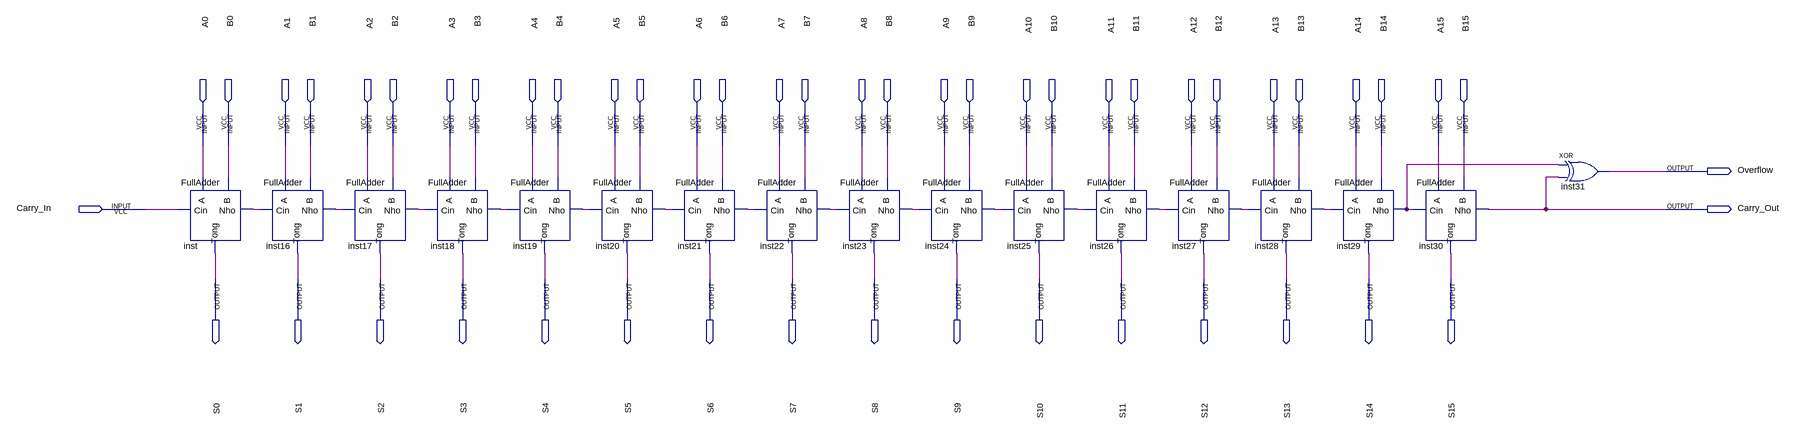
[diagram p0: schematic sheet]
// Quartus schematic FA_16bit.bdf as structural Verilog: 17 symbols, 51 pins
module FA_16bit (
  input  A0,
  input  B0,
  input  A1,
  input  B1,
  input  A2,
  input  B2,
  input  A3,
  input  B3,
  input  A4,
  input  B4,
  input  A5,
  input  B5,
  input  A6,
  input  B6,
  input  A7,
  input  B7,
  input  A8,
  input  B8,
  input  A9,
  input  B9,
  input  A10,
  input  B10,
  input  A11,
  input  B11,
  input  A12,
  input  B12,
  input  A13,
  input  B13,
  input  A14,
  input  B14,
  input  A15,
  input  B15,
  input  Carry_In,
  output Overflow,
  output Carry_Out,
  output S0,
  output S1,
  output S2,
  output S3,
  output S4,
  output S5,
  output S6,
  output S7,
  output S8,
  output S9,
  output S10,
  output S11,
  output S12,
  output S13,
  output S14,
  output S15
);

  wire inst16_nho, inst17_nho, inst18_nho, inst19_nho, inst20_nho, inst21_nho, inst22_nho, inst23_nho,
       inst24_nho, inst25_nho, inst26_nho, inst27_nho, inst28_nho, inst29_nho, inst_nho;

  FullAdder inst (.Cin(Carry_In), .A(A0), .B(B0), .Tong(S0), .Nho(inst_nho));
  FullAdder inst16 (.Cin(inst_nho), .A(A1), .B(B1), .Tong(S1), .Nho(inst16_nho));
  FullAdder inst17 (.Cin(inst16_nho), .A(A2), .B(B2), .Tong(S2), .Nho(inst17_nho));
  FullAdder inst18 (.Cin(inst17_nho), .A(A3), .B(B3), .Tong(S3), .Nho(inst18_nho));
  FullAdder inst19 (.Cin(inst18_nho), .A(A4), .B(B4), .Tong(S4), .Nho(inst19_nho));
  FullAdder inst20 (.Cin(inst19_nho), .A(A5), .B(B5), .Tong(S5), .Nho(inst20_nho));
  FullAdder inst21 (.Cin(inst20_nho), .A(A6), .B(B6), .Tong(S6), .Nho(inst21_nho));
  FullAdder inst22 (.Cin(inst21_nho), .A(A7), .B(B7), .Tong(S7), .Nho(inst22_nho));
  FullAdder inst23 (.Cin(inst22_nho), .A(A8), .B(B8), .Tong(S8), .Nho(inst23_nho));
  FullAdder inst24 (.Cin(inst23_nho), .A(A9), .B(B9), .Tong(S9), .Nho(inst24_nho));
  FullAdder inst25 (.Cin(inst24_nho), .A(A10), .B(B10), .Tong(S10), .Nho(inst25_nho));
  FullAdder inst26 (.Cin(inst25_nho), .A(A11), .B(B11), .Tong(S11), .Nho(inst26_nho));
  FullAdder inst27 (.Cin(inst26_nho), .A(A12), .B(B12), .Tong(S12), .Nho(inst27_nho));
  FullAdder inst28 (.Cin(inst27_nho), .A(A13), .B(B13), .Tong(S13), .Nho(inst28_nho));
  FullAdder inst29 (.Cin(inst28_nho), .A(A14), .B(B14), .Tong(S14), .Nho(inst29_nho));
  FullAdder inst30 (.Cin(inst29_nho), .A(A15), .B(B15), .Tong(S15), .Nho(Carry_Out));
  xor inst31 (Overflow, inst29_nho, Carry_Out);
endmodule
